# Altium schematic sheet 06 MIPI.SchDoc
size A3; Revision: V1.2; SheetNumber: 6; SheetTotal: 11
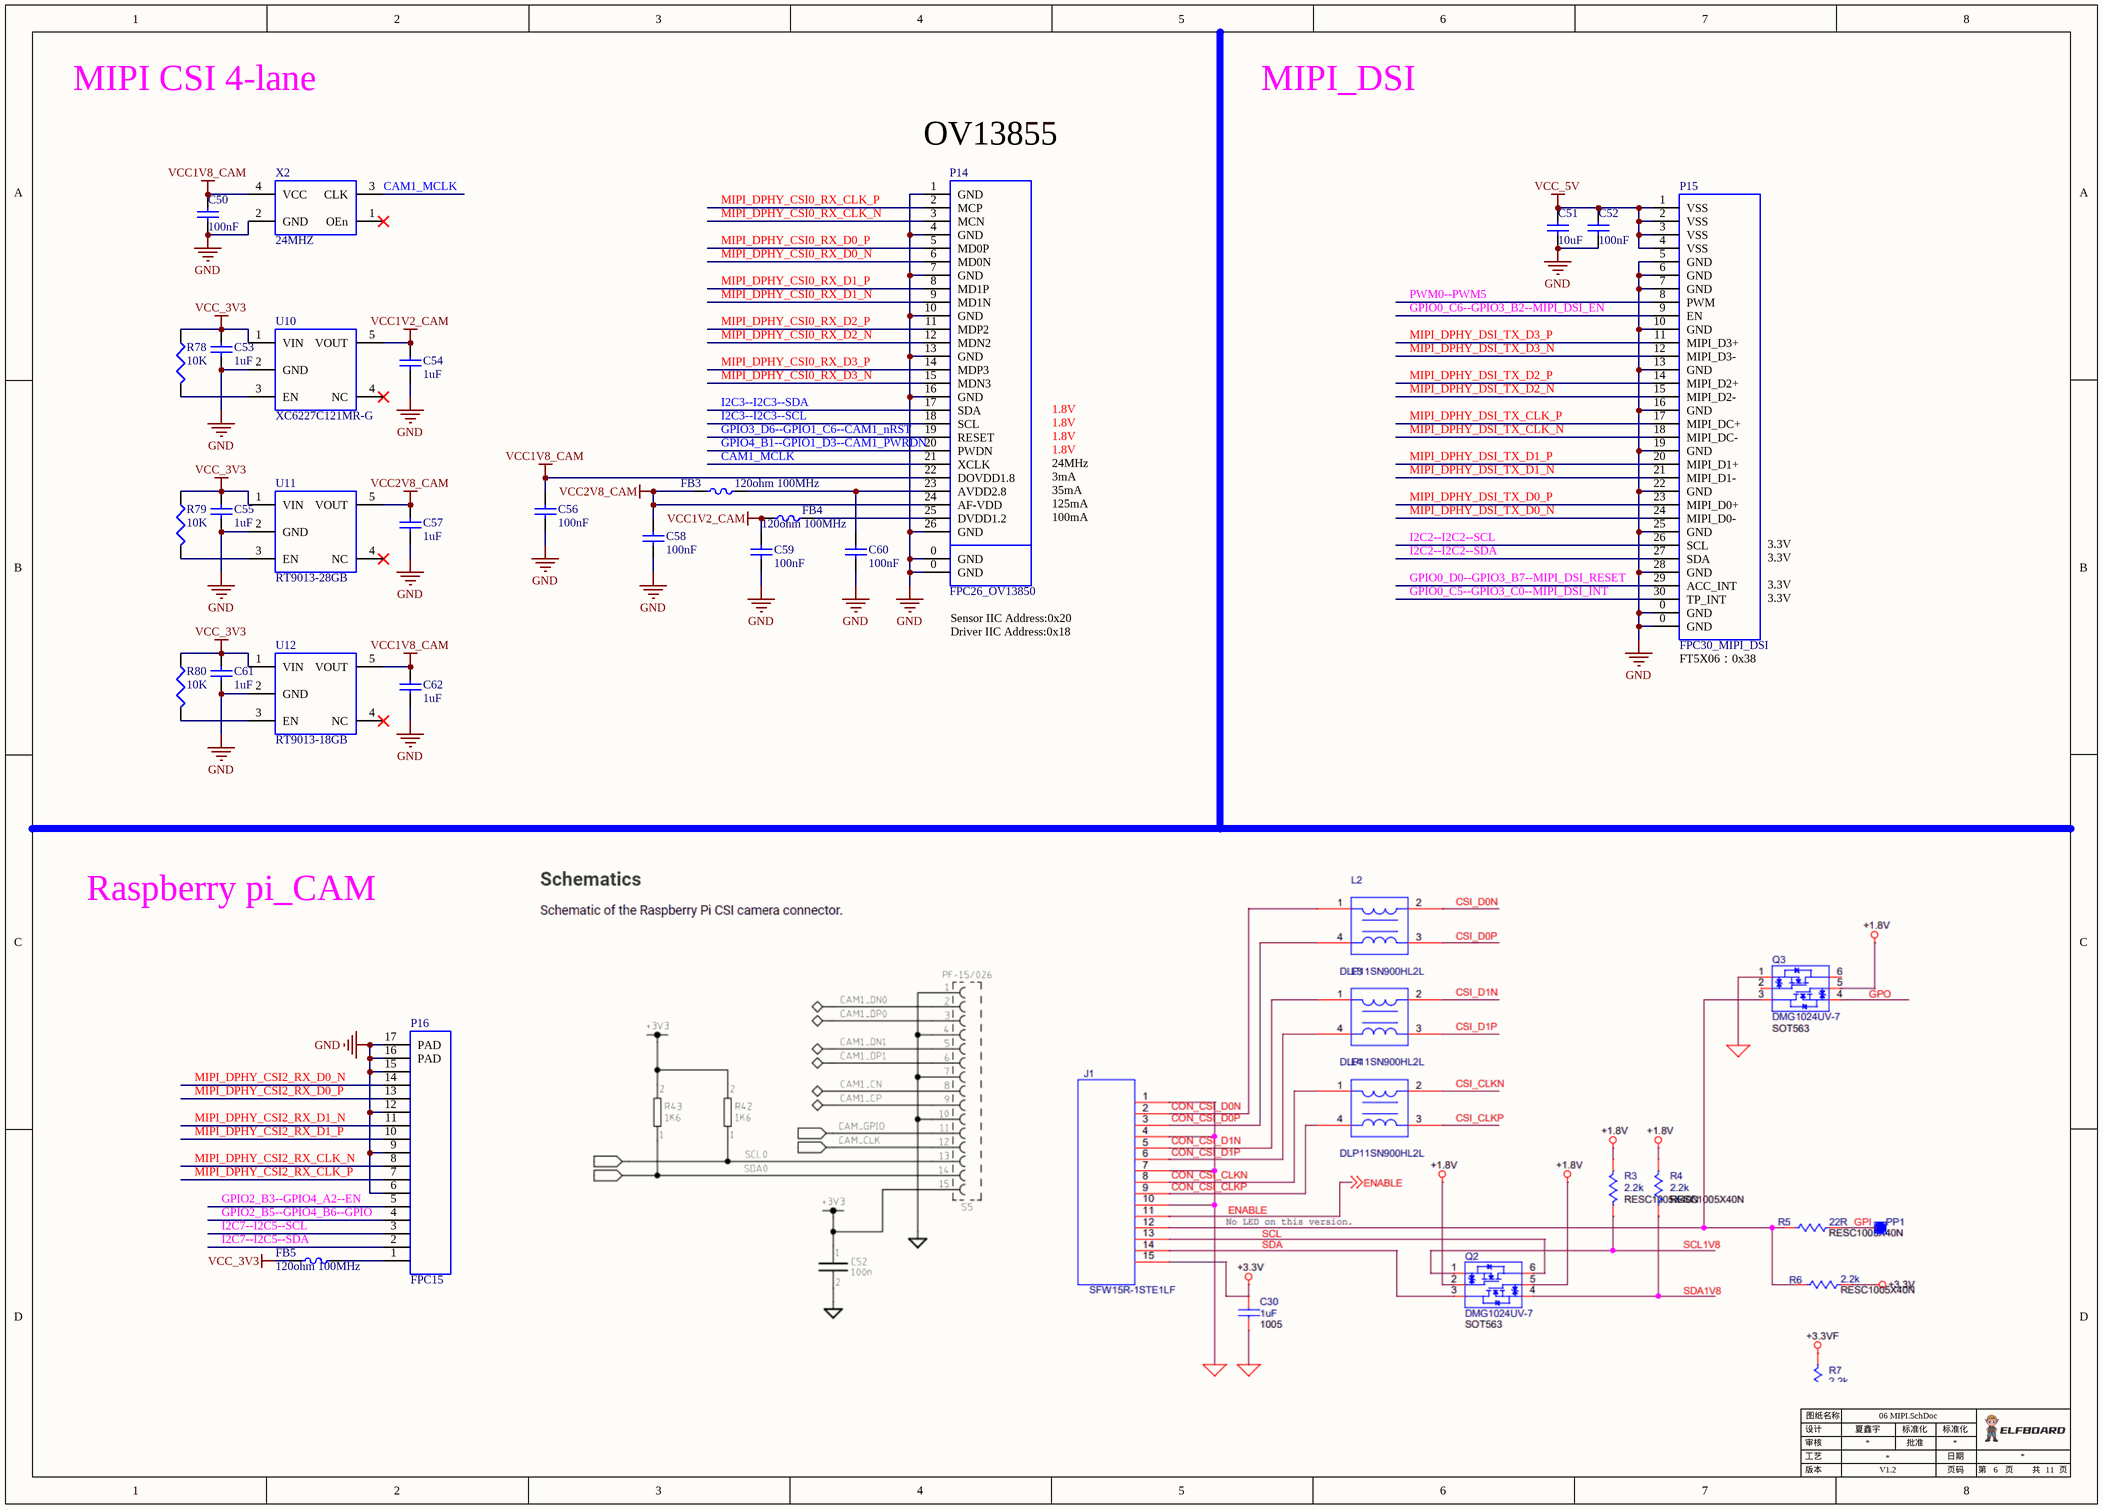
[diagram p0: 06 MIPI.SchDoc]

## Parts
C50  100nF  [0402C]
C51  10uF  [0603C]
C52  100nF  [0402C]
C53  1uF  [0402C]
C54  1uF  [0402C]
C55  1uF  [0402C]
C56  100nF  [0402C]
C57  1uF  [0402C]
C58  100nF  [0402C]
C59  100nF  [0402C]
C60  100nF  [0402C]
C61  1uF  [0402C]
C62  1uF  [0402C]
FB3  120ohm 100MHz  [0603L]
FB4  120ohm 100MHz  [0603L]
FB5  120ohm 100MHz  [0603L]
P14  FPC26_OV13850  [FPC26-a]
P15  FPC30_MIPI_DSI  [FPC30]
P16  FPC15  [FPC15-1-22_1X4_5-H5_4]
R78  10K  [0402R]
R79  10K  [0402R]
R80  10K  [0402R]
U10  XC6227C121MR-G  [SOT_235]
U11  RT9013-28GB  [SOT_235]
U12  RT9013-18GB  [SOT_235]
X2  24MHZ  [Crystals_3225]

## Nets
GND: C50.1 C51.1 C52.1 C53.1 C54.1 C55.1 C56.1 C57.1 C58.1 C59.1 C60.1 C61.1 C62.1 P14.0(GND) P14.1(GND) P14.4(GND) P14.7(GND) P14.10(GND) P14.13(GND) P14.16(GND) P14.26(GND) P15.0(GND) P15.5(GND) P15.6(GND) P15.7(GND) P15.10(GND) P15.13(GND) P15.16(GND) P15.19(GND) P15.22(GND) P15.25(GND) P15.28(GND) P16.6 P16.9 P16.12 P16.15 P16.16(PAD) P16.17(PAD) U10.2(GND) U11.2(GND) U12.2(GND) X2.2(GND)
VCC1V2_CAM: C54.2 C59.2 FB4.1 U10.5(VOUT)
VCC1V8_CAM: C50.2 C56.2 C62.2 P14.22(DOVDD1.8) U12.5(VOUT) X2.4(VCC)
VCC2V8_CAM: C57.2 C58.2 FB3.1 P14.24(AF-VDD) U11.5(VOUT)
VCC_3V3: C53.2 C55.2 C61.2 FB5.1 R78.1 R79.1 R80.1 U10.1(VIN) U11.1(VIN) U12.1(VIN)
VCC_5V: C51.2 C52.2 P15.1(VSS) P15.2(VSS) P15.3(VSS) P15.4(VSS)
CAM1_MCLK: P14.21(XCLK) X2.3(CLK)
GPIO0_C5--GPIO3_C0--MIPI_DSI_INT: P15.30(TP_INT)
GPIO0_C6--GPIO3_B2--MIPI_DSI_EN: P15.9(EN)
GPIO0_D0--GPIO3_B7--MIPI_DSI_RESET: P15.29(ACC_INT)
GPIO2_B3--GPIO4_A2--EN: P16.5
GPIO2_B5--GPIO4_B6--GPIO: P16.4
GPIO3_D6--GPIO1_C6--CAM1_nRST: P14.19(RESET)
GPIO4_B1--GPIO1_D3--CAM1_PWRDN: P14.20(PWDN)
I2C2--I2C2--SCL: P15.26(SCL)
I2C2--I2C2--SDA: P15.27(SDA)
I2C3--I2C3--SCL: P14.18(SCL)
I2C3--I2C3--SDA: P14.17(SDA)
I2C7--I2C5--SCL: P16.3
I2C7--I2C5--SDA: P16.2
MIPI_DPHY_CSI0_RX_CLK_N: P14.3(MCN)
MIPI_DPHY_CSI0_RX_CLK_P: P14.2(MCP)
MIPI_DPHY_CSI0_RX_D0_N: P14.6(MD0N)
MIPI_DPHY_CSI0_RX_D0_P: P14.5(MD0P)
MIPI_DPHY_CSI0_RX_D1_N: P14.9(MD1N)
MIPI_DPHY_CSI0_RX_D1_P: P14.8(MD1P)
MIPI_DPHY_CSI0_RX_D2_N: P14.12(MDN2)
MIPI_DPHY_CSI0_RX_D2_P: P14.11(MDP2)
MIPI_DPHY_CSI0_RX_D3_N: P14.15(MDN3)
MIPI_DPHY_CSI0_RX_D3_P: P14.14(MDP3)
MIPI_DPHY_CSI2_RX_CLK_N: P16.8
MIPI_DPHY_CSI2_RX_CLK_P: P16.7
MIPI_DPHY_CSI2_RX_D0_N: P16.14
MIPI_DPHY_CSI2_RX_D0_P: P16.13
MIPI_DPHY_CSI2_RX_D1_N: P16.11
MIPI_DPHY_CSI2_RX_D1_P: P16.10
MIPI_DPHY_DSI_TX_CLK_N: P15.18(MIPI_DC-)
MIPI_DPHY_DSI_TX_CLK_P: P15.17(MIPI_DC+)
MIPI_DPHY_DSI_TX_D0_N: P15.24(MIPI_D0-)
MIPI_DPHY_DSI_TX_D0_P: P15.23(MIPI_D0+)
MIPI_DPHY_DSI_TX_D1_N: P15.21(MIPI_D1-)
MIPI_DPHY_DSI_TX_D1_P: P15.20(MIPI_D1+)
MIPI_DPHY_DSI_TX_D2_N: P15.15(MIPI_D2-)
MIPI_DPHY_DSI_TX_D2_P: P15.14(MIPI_D2+)
MIPI_DPHY_DSI_TX_D3_N: P15.12(MIPI_D3-)
MIPI_DPHY_DSI_TX_D3_P: P15.11(MIPI_D3+)
PWM0--PWM5: P15.8(PWM)
NetC60_2: C60.2 FB3.2 P14.23(AVDD2.8)
NetFB4_2: FB4.2 P14.25(DVDD1.2)
NetFB5_2: FB5.2 P16.1
NetR78_2: R78.2 U10.3(EN)
NetR79_2: R79.2 U11.3(EN)
NetR80_2: R80.2 U12.3(EN)

Not connected (* = marked no-connect by the designer): U10 4(NC)*; U11 4(NC)*; U12 4(NC)*; X2 1(OEn)*

## Notes on the sheet
- MIPI CSI 4-lane
- MIPI_DSI
- (near P14) OV13855
- 1.8V
- 35mA
- 3mA
- 24MHz
- 125mA
- 100mA
- 3.3V
- (near P14) Sensor IIC Address:0x20
- Driver IIC Address:0x18
- (near P15) FT5X06：0x38
- Raspberry pi_CAM
- 设计
- 审核
- 工艺
- 图纸名称
- 夏鑫宇
- 批准
- 标准化
- 日期
- 版本
- 页码
- 第
- 页
- 共

## Library data of the parts
C50 C56 C58-C60 = 1110202001: 序号: 570; 存货名称: 贴装叠层陶瓷电容; 规格型号: 0402,100nF,16V,±10％,X7R; 主计量单位名称: 个; 安全库存: 2580445; 旧编码: 010201001; 旧规格型号: 0402 100nF 16V ±10％ X7R; Published: 8-Jun-2000; LatestRevisionDate: 17-Jul-2002; LatestRevisionNote: Re-released for DXP Platform.; PackageReference: RAD-0.3; Publisher: Altium Limited; PackageDescription: Radial Cap, Thru-Hole; 2 Leads; 0.3 in Pin Spacing; Value: 100nF; 存货编码: 1110202001
C51 = 1110203037: 序号: 672; 存货名称: 贴装叠层陶瓷电容; 规格型号: 0603,10uF,10V,±20％,X5R; Published: 8-Jun-2000; LatestRevisionDate: 17-Jul-2002; LatestRevisionNote: Re-released for DXP Platform.; PackageReference: RAD-0.3; Publisher: Altium Limited; PackageDescription: Radial Cap, Thru-Hole; 2 Leads; 0.3 in Pin Spacing; Value: 10uF; 存货编码: 1110203037
C52 = 1110202039: 序号: 626; 存货名称: 贴装叠层陶瓷电容; 规格型号: 0402,100nF,25V,±10％,X5R; Published: 8-Jun-2000; LatestRevisionDate: 17-Jul-2002; LatestRevisionNote: Re-released for DXP Platform.; PackageReference: RAD-0.3; Publisher: Altium Limited; PackageDescription: Radial Cap, Thru-Hole; 2 Leads; 0.3 in Pin Spacing; Value: 100nF; 存货编码: 1110202039
C53-C55 C57 C61 C62 = 1110202021: 序号: 600; 存货名称: 贴装叠层陶瓷电容; 规格型号: 0402,1uF,16V,±10％,X5R; Published: 8-Jun-2000; LatestRevisionDate: 17-Jul-2002; LatestRevisionNote: Re-released for DXP Platform.; PackageReference: RAD-0.3; Publisher: Altium Limited; PackageDescription: Radial Cap, Thru-Hole; 2 Leads; 0.3 in Pin Spacing; Value: 1uF; 存货编码: 1110202021
FB3-FB5 = 1110304009: 序号: 998; 存货名称: 磁珠; 规格型号: 0603,120 Ohm@100MHz,2A,BLM18PG121SN1; 描述栏信息: 村田; 主计量单位名称: 只; 安全库存: 148; 旧编码: 010301062; 旧规格型号: 0603 120Ohm 100MHz 2A BLM18PG121SN1 村田; VALUE: 120ohm 100MHz; 存货编码: 1110304009
P14 = FPC26_OV13850: 010401124; 序号: 51; 存货编码: 1120103021; 存货名称: FPC座; 规格型号: 26P,0.5mm,下接翻盖; 安全库存: 1831.00; Value: FPC26_OV13850; 旧编码: 010401124
P15 = FPC30_MIPI_DSI: 010401065; 序号: 53; 存货编码: 1120103013; 存货名称: FPC座; 规格型号: 30P,0.5mm,下接翻盖; 安全库存: 390.00; Value: FPC30_MIPI_DSI; 旧编码: 010401065
P16 = 1120103051: 存货名称: FPC座; 规格型号: 15P,1.0mm,抽屉式,贴片立式; 描述: 艾诺康; 禁用: 否; Value: FPC15; 存货编码: 1120103051
R78-R80 = 1110102007: 序号: 17; 存货名称: 贴装电阻; 规格型号: 0402,10K,±5％; Value: 10K; 存货编码: 1110102007
U10 = 1110404122: 序号: 1340; 存货名称: 电源; 规格型号: XC6227C121MR-G,SOT_25; 禁用: 否; 近三年购买频次: 近三年购买频次.8; Value: XC6227C121MR-G; 存货编码: 1110404122; 最近一次购买记录: 2024/12/19; 料号建立日期: 2019/11/23
U11 = 1110404096: 序号: 2092; 存货名称: 集成电路; 安全库存: 2574; 旧编码: 010504174; 存货编码: 1110404096; 规格型号: RT9013-28GB; Value: RT9013-28GB; 旧规格型号: RT9013-28GB
U12 = 1110404097: 序号: 2093; 存货名称: 电源; 规格型号: RT9013-18GB,SOT-23-5; Value: RT9013-18GB; 存货编码: 1110404097
X2 = 1110601007: 序号: 3406; 存货名称: 贴装晶振; 规格型号: 有源,24MHZ,4P,3.2*2.5mm,3.3V,±20ppm; Value: 24MHZ; 存货编码: 1110601007